# EasyEDA Pro project gnss-head.epro

# Board gnss-head
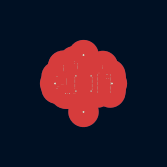
[diagram p0: board, top side]
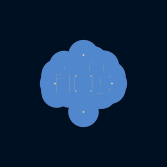
[diagram p1: board, bottom side, seen from below]

No outline. copper layers: Top, Bottom Layer. Coordinates in mm from the lowest, leftmost part position.
Stack: Top Layer 0.0009mm COPPER / Bottom Layer 0.0009mm COPPER

## Placement (name value [footprint] x y rotation side)
NOREF  -  [Pad_e190]  0.62 0.91 0 top
NOREF#2  -  [Pad_e161]  1.85 1.39 0 top
NOREF#3  -  [Pad_e165]  1.85 1.65 0 top
NOREF#4  -  [Pad_e134]  2.76 1.81 0 top
NOREF#5  -  [Pad_e142]  2.76 1.29 0 top
NOREF#6  -  [Pad_e181]  0.41 2.12 0 top
NOREF#7  -  [Pad_e198]  0.97 2.54 0 top
NOREF#8  -  [Pad_e203]  2.84 1.42 0 top
NOREF#9  -  [Pad_e179]  0.41 2.25 0 top
NOREF#10  -  [Pad_e152]  0.99 1.45 0 top
NOREF#11  -  [Pad_e174]  0.56 1.65 0 top
NOREF#12  -  [Pad_e155]  0.99 1.65 0 top
NOREF#13  -  [Pad_e133]  2.76 1.87 0 top
NOREF#14  -  [Pad_e149]  0.99 1.26 0 top
NOREF#15  -  [Pad_e119]  2.12 1.81 0 top
NOREF#16  -  [Pad_e178]  0.41 2.31 0 top
NOREF#17  -  [Pad_e136]  2.76 1.68 0 top
NOREF#18  -  [Pad_e175]  2.39 2.17 0 top
NOREF#19  -  [Pad_e118]  2.12 1.87 0 top
NOREF#20  -  [Pad_e141]  2.76 1.36 0 top
NOREF#21  -  [Pad_e206]  1.42 2.84 0 top
NOREF#22  -  [Pad_e191]  0.08 1.78 0 top
NOREF#23  -  [Pad_e151]  0.99 1.39 0 top
NOREF#24  -  [Pad_e188]  0.52 0.91 0 top
NOREF#25  -  [Pad_e204]  1.42 0 0 top
NOREF#26  -  [Pad_e194]  0.13 1.17 0 top
NOREF#27  -  [Pad_e166]  1.85 1.71 0 top
NOREF#28  -  [Pad_e182]  0.41 2.06 0 top
NOREF#29  -  [Pad_e147]  2.76 0.97 0 top
NOREF#30  -  [Pad_e168]  2.64 1.87 0 top
NOREF#31  -  [Pad_e205]  0 1.42 0 top
NOREF#32  -  [Pad_e162]  1.85 1.45 0 top
NOREF#33  -  [Pad_e186]  1.12 2.22 0 top
NOREF#34  -  [Pad_e183]  1.12 2.41 0 top
NOREF#35  -  [Pad_e170]  0.56 1.45 0 top
NOREF#36  -  [Pad_e158]  1.85 1.2 0 top
NOREF#37  -  [Pad_e201]  1.8 1.8 0 top
NOREF#38  -  [Pad_e169]  0.56 1.4 0 top
NOREF#39  -  [Pad_e199]  1.04 1.8 0 top
NOREF#40  -  [Pad_e180]  0.41 2.18 0 top
NOREF#41  -  [Pad_e128]  2.12 1.23 0 top
NOREF#42  -  [Pad_e129]  2.12 1.16 0 top
NOREF#43  -  [Pad_e143]  2.76 1.23 0 top
NOREF#44  -  [Pad_e124]  2.12 1.49 0 top
NOREF#45  -  [Pad_e120]  2.12 1.75 0 top
NOREF#46  -  [Pad_e156]  0.99 1.71 0 top
NOREF#47  -  [Pad_e154]  0.99 1.58 0 top
NOREF#48  -  [Pad_e126]  2.12 1.36 0 top
NOREF#49  -  [Pad_e137]  2.76 1.62 0 top
NOREF#50  -  [Pad_e197]  0.97 2.44 0 top
NOREF#51  -  [Pad_e121]  2.12 1.68 0 top
NOREF#52  -  [Pad_e135]  2.76 1.75 0 top
NOREF#53  -  [Pad_e131]  2.12 1.04 0 top
NOREF#54  -  [Pad_e177]  2.39 2.3 0 top
NOREF#55  -  [Pad_e196]  2.69 1.68 0 top
NOREF#56  -  [Pad_e163]  1.85 1.52 0 top
NOREF#57  -  [Pad_e122]  2.12 1.62 0 top
NOREF#58  -  [Pad_e173]  0.56 1.6 0 top
NOREF#59  -  [Pad_e148]  0.99 1.2 0 top
NOREF#60  -  [Pad_e200]  1.04 1.04 0 top
NOREF#61  -  [Pad_e171]  0.56 1.5 0 top
NOREF#62  -  [Pad_e138]  2.76 1.55 0 top
NOREF#63  -  [Pad_e159]  1.85 1.26 0 top
NOREF#64  -  [Pad_e139]  2.76 1.49 0 top
NOREF#65  -  [Pad_e145]  2.76 1.1 0 top
NOREF#66  -  [Pad_e195]  2.59 1.68 0 top
NOREF#67  -  [Pad_e189]  0.72 0.91 0 top
NOREF#68  -  [Pad_e150]  0.99 1.33 0 top
NOREF#69  -  [Pad_e176]  2.39 2.24 0 top
NOREF#70  -  [Pad_e164]  1.85 1.58 0 top
NOREF#71  -  [Pad_e172]  0.56 1.55 0 top
NOREF#72  -  [Pad_e125]  2.12 1.42 0 top
NOREF#73  -  [Pad_e144]  2.76 1.16 0 top
NOREF#74  -  [Pad_e123]  2.12 1.55 0 top
NOREF#75  -  [Pad_e153]  0.99 1.52 0 top
NOREF#76  -  [Pad_e167]  2.58 1.87 0 top
NOREF#77  -  [Pad_e140]  2.76 1.42 0 top
NOREF#78  -  [Pad_e146]  2.76 1.04 0 top
NOREF#79  -  [Pad_e192]  0.13 1.78 0 top
NOREF#80  -  [Pad_e187]  1.12 2.16 0 top
NOREF#81  -  [Pad_e132]  2.12 0.97 0 top
NOREF#82  -  [Pad_e127]  2.12 1.29 0 top
NOREF#83  -  [Pad_e185]  1.12 2.29 0 top
NOREF#84  -  [Pad_e160]  1.85 1.33 0 top
NOREF#85  -  [Pad_e157]  1.85 1.13 0 top
NOREF#86  -  [Pad_e130]  2.12 1.1 0 top
NOREF#87  -  [Pad_e193]  0.08 1.17 0 top
NOREF#88  -  [Pad_e202]  1.8 1.04 0 top
NOREF#89  -  [Pad_e184]  1.12 2.35 0 top

## Footprints (pads in the part's own frame, mm; a bottom-side part is the same pattern mirrored in y, then rotated)
Pad_e118
  round 1.524 hole 0.025: 3V3(0,0)
Pad_e119
  round 1.524 hole 0.025: GND(0,0)
Pad_e120
  round 1.524 hole 0.025: 15(0,0)
Pad_e121
  round 1.524 hole 0.025: 2(0,0)
Pad_e122
  round 1.524 hole 0.025: 4(0,0)
Pad_e123
  round 1.524 hole 0.025: 16(0,0)
Pad_e124
  round 1.524 hole 0.025: 17(0,0)
Pad_e125
  round 1.524 hole 0.025: 5(0,0)
Pad_e126
  round 1.524 hole 0.025: 18(0,0)
Pad_e127
  round 1.524 hole 0.025: 19(0,0)
Pad_e128
  round 1.524 hole 0.025: 21(0,0)
Pad_e129
  round 1.524 hole 0.025: RX0(0,0)
Pad_e130
  round 1.524 hole 0.025: TX0(0,0)
Pad_e131
  round 1.524 hole 0.025: 22(0,0)
Pad_e132
  round 1.524 hole 0.025: 23(0,0)
Pad_e133
  round 1.524 hole 0.025: VIN(0,0)
Pad_e134
  round 1.524 hole 0.025: GND2(0,0)
Pad_e135
  round 1.524 hole 0.025: 13(0,0)
Pad_e136
  round 1.524 hole 0.025: 12(0,0)
Pad_e137
  round 1.524 hole 0.025: 14(0,0)
Pad_e138
  round 1.524 hole 0.025: 27(0,0)
Pad_e139
  round 1.524 hole 0.025: 26(0,0)
Pad_e140
  round 1.524 hole 0.025: 25(0,0)
Pad_e141
  round 1.524 hole 0.025: 33(0,0)
Pad_e142
  round 1.524 hole 0.025: 32(0,0)
Pad_e143
  round 1.524 hole 0.025: 35(0,0)
Pad_e144
  round 1.524 hole 0.025: 34(0,0)
Pad_e145
  round 1.524 hole 0.025: VN(0,0)
Pad_e146
  round 1.524 hole 0.025: VP(0,0)
Pad_e147
  round 1.524 hole 0.025: EN(0,0)
Pad_e148
  round 1.524 hole 0.025: 1(0,0)
Pad_e149
  round 1.524 hole 0.025: 2(0,0)
Pad_e150
  round 1.524 hole 0.025: 3(0,0)
Pad_e151
  round 1.524 hole 0.025: 4(0,0)
Pad_e152
  round 1.524 hole 0.025: 5(0,0)
Pad_e153
  round 1.524 hole 0.025: 6(0,0)
Pad_e154
  round 1.524 hole 0.025: 7(0,0)
Pad_e155
  round 1.524 hole 0.025: 8(0,0)
Pad_e156
  round 1.524 hole 0.025: 9(0,0)
Pad_e157
  round 1.524 hole 0.025: 1(0,0)
Pad_e158
  round 1.524 hole 0.025: 2(0,0)
Pad_e159
  round 1.524 hole 0.025: 3(0,0)
Pad_e160
  round 1.524 hole 0.025: 4(0,0)
Pad_e161
  round 1.524 hole 0.025: 5(0,0)
Pad_e162
  round 1.524 hole 0.025: 6(0,0)
Pad_e163
  round 1.524 hole 0.025: 7(0,0)
Pad_e164
  round 1.524 hole 0.025: 8(0,0)
Pad_e165
  round 1.524 hole 0.025: 9(0,0)
Pad_e166
  round 1.524 hole 0.025: 10(0,0)
Pad_e167
  round 1.524 hole 0.025: 1(0,0)
Pad_e168
  round 1.524 hole 0.025: 2(0,0)
Pad_e169
  round 1.524 hole 0.023: 1(0,0)
Pad_e170
  round 1.524 hole 0.023: 2(0,0)
Pad_e171
  round 1.524 hole 0.023: 3(0,0)
Pad_e172
  round 1.524 hole 0.023: 4(0,0)
Pad_e173
  round 1.524 hole 0.023: 5(0,0)
Pad_e174
  round 1.524 hole 0.023: 6(0,0)
Pad_e175
  round 1.524 hole 0.023: VCC(0,0)
Pad_e176
  round 1.524 hole 0.023: IO(0,0)
Pad_e177
  round 1.524 hole 0.023: GND(0,0)
Pad_e178
  round 1.524 hole 0.025: 1(0,0)
Pad_e179
  round 1.524 hole 0.025: 2(0,0)
Pad_e180
  round 1.524 hole 0.025: 3(0,0)
Pad_e181
  round 1.524 hole 0.025: 4(0,0)
Pad_e182
  round 1.524 hole 0.025: 5(0,0)
Pad_e183
  round 1.524 hole 0.025: 1(0,0)
Pad_e184
  round 1.524 hole 0.025: 2(0,0)
Pad_e185
  round 1.524 hole 0.025: 3(0,0)
Pad_e186
  round 1.524 hole 0.025: 4(0,0)
Pad_e187
  round 1.524 hole 0.025: 5(0,0)
Pad_e188
  round 1.524 hole 0.03: +(0,0)
Pad_e189
  round 1.524 hole 0.03: -(0,0)
Pad_e190
  round 1.524 hole 0.023: K(0,0)
Pad_e191
  round 1.524 hole 0.023: 1(0,0)
Pad_e192
  round 1.524 hole 0.023: 2(0,0)
Pad_e193
  round 1.524 hole 0.023: 1(0,0)
Pad_e194
  round 1.524 hole 0.023: 2(0,0)
Pad_e195
  round 1.524 hole 0.025: 1(0,0)
Pad_e196
  round 1.524 hole 0.025: 2(0,0)
Pad_e197
  round 1.524 hole 0.023: 1(0,0)
Pad_e198
  round 1.524 hole 0.023: 2(0,0)
Pad_e199
  round 1.524 hole 0.056: (0,0)
Pad_e200
  round 1.524 hole 0.056: (0,0)
Pad_e201
  round 1.524 hole 0.056: (0,0)
Pad_e202
  round 1.524 hole 0.056: (0,0)
Pad_e203
  round 1.524 hole 0.082: (0,0)
Pad_e204
  round 1.524 hole 0.082: (0,0)
Pad_e205
  round 1.524 hole 0.082: (0,0)
Pad_e206
  round 1.524 hole 0.082: (0,0)

## Nets
3V3: NOREF#16.1 NOREF#19.3V3
5V: NOREF#12.8 NOREF#18.VCC NOREF#22.1 NOREF#24.+ NOREF#34.1 NOREF#38.1 NOREF#50.1 NOREF#76.1
GND: NOREF#4.GND2 NOREF#7.2 NOREF#9.2 NOREF#15.GND NOREF#26.2 NOREF#27.10 NOREF#46.9 NOREF#54.GND NOREF#58.5 NOREF#67.- NOREF#79.2 NOREF#89.2
VIN: NOREF#13.VIN NOREF#30.2
BUZZER: NOREF#69.IO NOREF#81.23
HC12_SET: NOREF#77.25 NOREF#80.5
I2C_SCL: NOREF#40.3 NOREF#53.22
I2C_SDA: NOREF#6.4 NOREF#41.21
PSU_K: NOREF.K NOREF#87.1
UART1_RX: NOREF#64.26 NOREF#66.1
UART1_RX_HC: NOREF#33.4 NOREF#55.2
UART1_TX: NOREF#62.27 NOREF#83.3
UART2_RX: NOREF#61.3 NOREF#74.16 NOREF#75.6
UART2_TX: NOREF#10.5 NOREF#35.2 NOREF#44.17

Pads without a net: NOREF#2 5; NOREF#3 9; NOREF#5 32; NOREF#11 6; NOREF#14 2; NOREF#17 12; NOREF#20 33; NOREF#23 4; NOREF#28 5; NOREF#29 EN; NOREF#32 6; NOREF#36 2; NOREF#42 RX0; NOREF#43 35; NOREF#45 15; NOREF#47 7; NOREF#48 18; NOREF#49 14; NOREF#51 2; NOREF#52 13; NOREF#56 7; NOREF#57 4; NOREF#59 1; NOREF#63 3; NOREF#65 VN; NOREF#68 3; NOREF#70 8; NOREF#71 4; NOREF#72 5; NOREF#73 34; NOREF#78 VP; NOREF#82 19; NOREF#84 4; NOREF#85 1; NOREF#86 TX0

## Via types
v1: diameter 0.021, hole 0.01, Top to Bottom Layer, 11 vias

## Routing (per net, layer and track width the routed paths; a pad name or vN(x,y) marks a point on that pad's centre or on a via; arc(x,y) is an arc through that point)
3V3: length 0.5
  Bottom Layer w0.01: v1(0.58,2.01) 0.58,2.31 NOREF#16.1
5V: length 5.8
  Bottom Layer w0.021: 0.13,1.78 0.74,1.78 0.74,2.44 NOREF#50.1 1.12,2.44 NOREF#34.1 ; 0.74,1.4 NOREF#38.1 ; NOREF#12.8 0.74,1.65 0.74,0.91
  Bottom Layer w0.025: 0.72,0.91 0.74,0.91 0.74,2.03 v1(2.58,2.03)
GND: length 1.3
  Bottom Layer w0.015: v1(0.52,0.91) 0.08,0.91 0.08,1.78
  vias: v1(0.08,1.17) v1(0.56,1.6) v1(0.97,2.54) v1(1.12,2.35) v1(2.12,1.81) v1(2.76,1.81)
BUZZER: length 1.8
  Bottom Layer w0.01: NOREF#69.IO 2.26,2.24 2.26,1.78 1.98,1.78 1.98,0.97 NOREF#81.23
HC12_SET: length 2.9
  Bottom Layer w0.009: NOREF#80.5 0.86,2.16 0.86,1.88 2.08,1.88 2.08,1.42 NOREF#77.25
I2C_SCL: length 0.3
  Bottom Layer w0.009: v1(0.52,1.96) 0.52,2.18 NOREF#40.3
I2C_SDA: length 0.2
  Bottom Layer w0.009: v1(0.46,1.98) 0.46,2.12 NOREF#6.4
PSU_K: length 0.7
  Bottom Layer w0.013: 0.13,1.17 0.2,1.17 0.2,1.07 0.62,1.07 NOREF.K
UART1_RX: length 0.2
  Bottom Layer w0.009: NOREF#64.26 2.69,1.68
UART1_RX_HC: length 2.4
  Bottom Layer w0.009: NOREF#33.4 0.94,2.22 0.94,1.98 2.13,1.98 2.13,1.68 2.59,1.68
UART1_TX: length 2.6
  Bottom Layer w0.009: NOREF#83.3 1.02,2.29 1.02,1.93 2.18,1.93 2.18,1.55 NOREF#62.27

## Text on the board
Bottom Silkscreen Layer: J5 BAT | SW3 PWR SW | USB-C 5V | K | HC-12
Top Silkscreen Layer: J8 K-GND | J7 JST-PH6 | K902 38x38 | ESP32
